# Altium schematic sheet FPGA_breadboard_connections.SchDoc
size A3; SheetNumber: 4; SheetTotal: 18
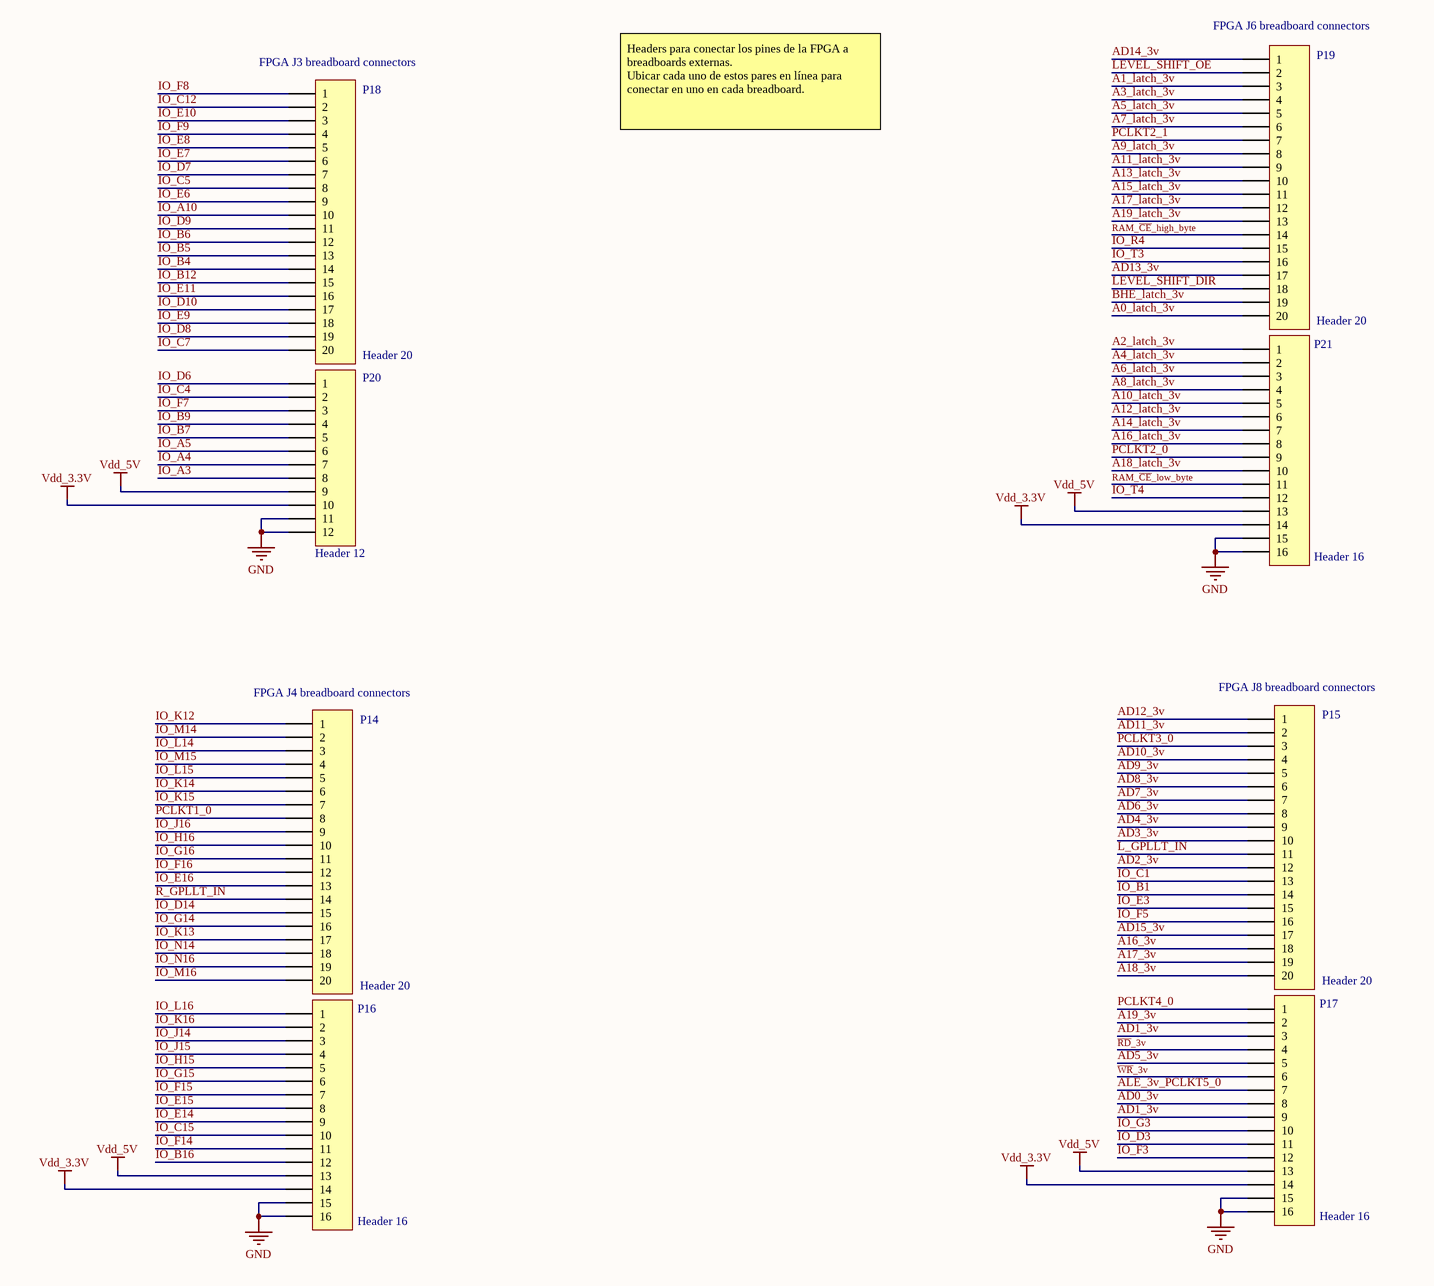
[diagram p0: FPGA_breadboard_connections.SchDoc]

## Parts
P14  Header 20  [HDR1X20]
P15  Header 20  [HDR1X20]
P16  Header 16  [HDR1X16]
P17  Header 16  [HDR1X16]
P18  Header 20  [HDR1X20]
P19  Header 20  [HDR1X20]
P20  Header 12  [HDR1X12]
P21  Header 16  [HDR1X16]

## Nets
GND: P16.15 P16.16 P17.15 P17.16 P20.11 P20.12 P21.15 P21.16
Vdd_3.3V: P16.14 P17.14 P20.10 P21.14
Vdd_5V: P16.13 P17.13 P20.9 P21.13
A0_latch_3v: P19.20
A1_latch_3v: P19.3
A2_latch_3v: P21.1
A3_latch_3v: P19.4
A4_latch_3v: P21.2
A5_latch_3v: P19.5
A6_latch_3v: P21.3
A7_latch_3v: P19.6
A8_latch_3v: P21.4
A9_latch_3v: P19.8
A10_latch_3v: P21.5
A11_latch_3v: P19.9
A12_latch_3v: P21.6
A13_latch_3v: P19.10
A14_latch_3v: P21.7
A15_latch_3v: P19.11
A16_3v: P15.18
A16_latch_3v: P21.8
A17_3v: P15.19
A17_latch_3v: P19.12
A18_3v: P15.20
A18_latch_3v: P21.10
A19_3v: P17.2
A19_latch_3v: P19.13
AD0_3v: P17.8
AD1_3v: P17.3 P17.9
AD2_3v: P15.12
AD3_3v: P15.10
AD4_3v: P15.9
AD5_3v: P17.5
AD6_3v: P15.8
AD7_3v: P15.7
AD8_3v: P15.6
AD9_3v: P15.5
AD10_3v: P15.4
AD11_3v: P15.2
AD12_3v: P15.1
AD13_3v: P19.17
AD14_3v: P19.1
AD15_3v: P15.17
ALE_3v_PCLKT5_0: P17.7
~{BHE}_latch_3v: P19.19
IO_A3: P20.8
IO_A4: P20.7
IO_A5: P20.6
IO_A10: P18.10
IO_B1: P15.14
IO_B4: P18.14
IO_B5: P18.13
IO_B6: P18.12
IO_B7: P20.5
IO_B9: P20.4
IO_B12: P18.15
IO_B16: P16.12
IO_C1: P15.13
IO_C4: P20.2
IO_C5: P18.8
IO_C7: P18.20
IO_C12: P18.2
IO_C15: P16.10
IO_D3: P17.11
IO_D6: P20.1
IO_D7: P18.7
IO_D8: P18.19
IO_D9: P18.11
IO_D10: P18.17
IO_D14: P14.15
IO_E3: P15.15
IO_E6: P18.9
IO_E7: P18.6
IO_E8: P18.5
IO_E9: P18.18
IO_E10: P18.3
IO_E11: P18.16
IO_E14: P16.9
IO_E15: P16.8
IO_E16: P14.13
IO_F3: P17.12
IO_F5: P15.16
IO_F7: P20.3
IO_F8: P18.1
IO_F9: P18.4
IO_F14: P16.11
IO_F15: P16.7
IO_F16: P14.12
IO_G3: P17.10
IO_G14: P14.16
IO_G15: P16.6
IO_G16: P14.11
IO_H15: P16.5
IO_H16: P14.10
IO_J14: P16.3
IO_J15: P16.4
IO_J16: P14.9
IO_K12: P14.1
IO_K13: P14.17
IO_K14: P14.6
IO_K15: P14.7
IO_K16: P16.2
IO_L14: P14.3
IO_L15: P14.5
IO_L16: P16.1
IO_M14: P14.2
IO_M15: P14.4
IO_M16: P14.20
IO_N14: P14.18
IO_N16: P14.19
IO_R4: P19.15
IO_T3: P19.16
IO_T4: P21.12
L_GPLLT_IN: P15.11
LEVEL_SHIFT_DIR: P19.18
LEVEL_SHIFT_~{OE}: P19.2
PCLKT1_0: P14.8
PCLKT2_0: P21.9
PCLKT2_1: P19.7
PCLKT3_0: P15.3
PCLKT4_0: P17.1
~{RD}_3v: P17.4
R_GPLLT_IN: P14.14
RAM_~{CE}_high_byte: P19.14
RAM_~{CE}_low_byte: P21.11
~{WR}_3v: P17.6

## Notes on the sheet
- (near P19) FPGA J6 breadboard connectors
- (near P18) FPGA J3 breadboard connectors
- Headers para conectar los pines de la FPGA a breadboards externas.
  Ubicar cada uno de estos pares en línea para conectar en uno en cada breadboard.
- (near P14) FPGA J4 breadboard connectors
- (near P15) FPGA J8 breadboard connectors

## Library data of the parts
P14 P15 P18 P19 = Header 20: Header, 20-Pin; LatestRevisionDate: 17-Jul-2002; LatestRevisionNote: Re-released for DXP Platform.; Publisher: Altium Limited
P16 P17 P21 = Header 16: Header, 16-Pin; LatestRevisionDate: 17-Jul-2002; LatestRevisionNote: Re-released for DXP Platform.; Publisher: Altium Limited
P20 = Header 12: Header, 12-Pin; LatestRevisionDate: 17-Jul-2002; LatestRevisionNote: Re-released for DXP Platform.; Publisher: Altium Limited